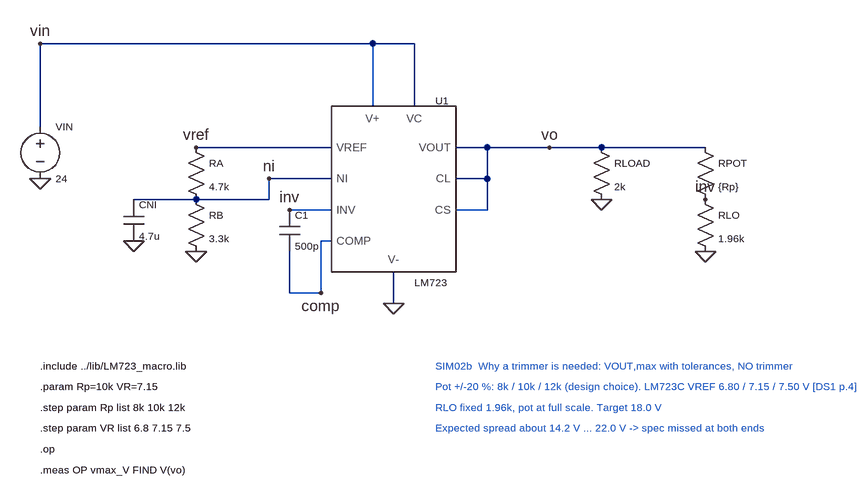
[diagram p0: schematic SIM02b_tolerance_uncalibrated.asc]
SIM02b_tolerance_uncalibrated.asc, the LTspice schematic file:
Version 4
SHEET 1 1400 900
WIRE 96 304 96 176
WIRE 96 176 672 176
WIRE 608 176 608 272
WIRE 672 176 672 272
WIRE 640 528 640 576
WIRE 544 336 336 336
WIRE 336 416 448 416
WIRE 448 416 448 384
WIRE 448 384 544 384
WIRE 240 416 336 416
WIRE 544 432 480 432
WIRE 544 480 528 480
WIRE 528 480 528 560
WIRE 528 560 480 560
WIRE 480 560 480 496
WIRE 736 336 960 336
WIRE 736 384 784 384
WIRE 784 384 784 336
WIRE 736 432 784 432
WIRE 784 432 784 384
WIRE 960 336 1120 336
FLAG 96 384 0
FLAG 640 576 0
FLAG 336 496 0
FLAG 240 480 0
FLAG 96 176 vin
FLAG 336 336 vref
FLAG 448 384 ni
FLAG 480 432 inv
FLAG 528 560 comp
FLAG 880 336 vo
FLAG 960 416 0
FLAG 1120 416 inv
FLAG 1120 496 0
SYMBOL voltage 96 288 R0
WINDOW 0 24 16 Left 1
WINDOW 3 24 96 Left 1
SYMATTR InstName VIN
SYMATTR Value 24
SYMBOL LM723 640 400 R0
WINDOW 0 64 -136 Left 1
WINDOW 3 32 144 Left 1
SYMATTR InstName U1
SYMATTR SpiceLine VR={VR}
SYMBOL res 320 320 R0
WINDOW 0 36 40 Left 1
WINDOW 3 36 76 Left 1
SYMATTR InstName RA
SYMATTR Value 4.7k
SYMBOL res 320 400 R0
WINDOW 0 36 40 Left 1
WINDOW 3 36 76 Left 1
SYMATTR InstName RB
SYMATTR Value 3.3k
SYMBOL cap 224 416 R0
WINDOW 0 24 8 Left 1
WINDOW 3 24 56 Left 1
SYMATTR InstName CNI
SYMATTR Value 4.7u
SYMBOL cap 464 432 R0
WINDOW 0 24 8 Left 1
WINDOW 3 24 56 Left 1
SYMATTR InstName C1
SYMATTR Value 500p
SYMBOL res 944 320 R0
WINDOW 0 36 40 Left 1
WINDOW 3 36 76 Left 1
SYMATTR InstName RLOAD
SYMATTR Value 2k
SYMBOL res 1104 320 R0
WINDOW 0 36 40 Left 1
WINDOW 3 36 76 Left 1
SYMATTR InstName RPOT
SYMATTR Value {Rp}
SYMBOL res 1104 400 R0
WINDOW 0 36 40 Left 1
WINDOW 3 36 76 Left 1
SYMATTR InstName RLO
SYMATTR Value 1.96k
TEXT 96 672 Left 1 !.include ../lib/LM723_macro.lib
TEXT 96 704 Left 1 !.param Rp=10k VR=7.15
TEXT 96 736 Left 1 !.step param Rp list 8k 10k 12k
TEXT 96 768 Left 1 !.step param VR list 6.8 7.15 7.5
TEXT 96 800 Left 1 !.op
TEXT 96 832 Left 1 !.meas OP vmax_V FIND V(vo)
TEXT 704 672 Left 1 ;SIM02b  Why a trimmer is needed: VOUT,max with tolerances, NO trimmer
TEXT 704 704 Left 1 ;Pot +/-20 %: 8k / 10k / 12k (design choice). LM723C VREF 6.80 / 7.15 / 7.50 V [DS1 p.4]
TEXT 704 736 Left 1 ;RLO fixed 1.96k, pot at full scale. Target 18.0 V
TEXT 704 768 Left 1 ;Expected spread about 14.2 V ... 22.0 V -> spec missed at both ends

The netlist it stands for:
* SIM02b_tolerance_uncalibrated.asc
VIN vin 0 24
XU1 vin 0 vin vo vref ni inv comp vo vo LM723 VR={VR}  ; pins V+ V- VC VOUT VREF NI INV COMP CL CS
RA vref ni 4.7k
RB ni 0 3.3k
CNI ni 0 4.7u
C1 inv comp 500p
RLOAD vo 0 2k
RPOT vo inv {Rp}
RLO inv 0 1.96k
.include ../lib/LM723_macro.lib
.param Rp=10k VR=7.15
.step param Rp list 8k 10k 12k
.step param VR list 6.8 7.15 7.5
.op
.meas OP vmax_V FIND V(vo)
* SIM02b  Why a trimmer is needed: VOUT,max with tolerances, NO trimmer
* Pot +/-20 %: 8k / 10k / 12k (design choice). LM723C VREF 6.80 / 7.15 / 7.50 V [DS1 p.4]
* RLO fixed 1.96k, pot at full scale. Target 18.0 V
* Expected spread about 14.2 V ... 22.0 V -> spec missed at both ends
.backanno
.end